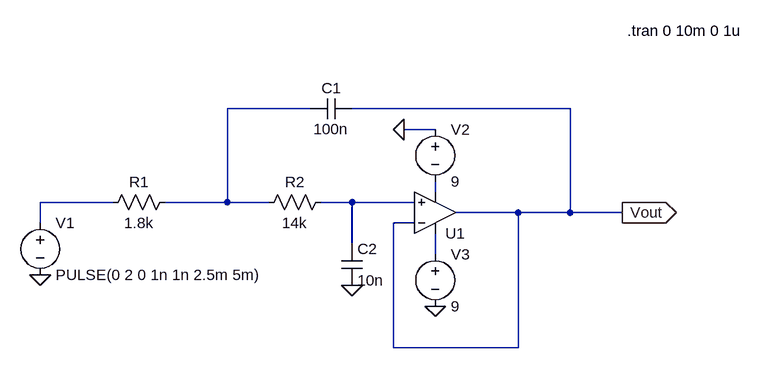
[diagram p0: schematic sallen_key_lowpass.asc]
sallen_key_lowpass.asc, the LTspice schematic file:
Version 4.1
SHEET 1 1196 680
WIRE 512 -16 384 -16
WIRE 912 -16 576 -16
WIRE 704 16 656 16
WIRE 704 112 704 96
WIRE 208 128 96 128
WIRE 384 128 384 -16
WIRE 384 128 288 128
WIRE 448 128 384 128
WIRE 576 128 528 128
WIRE 672 128 576 128
WIRE 832 144 736 144
WIRE 912 144 912 -16
WIRE 912 144 832 144
WIRE 992 144 912 144
WIRE 96 160 96 128
WIRE 672 160 640 160
WIRE 576 192 576 128
WIRE 704 208 704 176
WIRE 640 352 640 160
WIRE 832 352 832 144
WIRE 832 352 640 352
FLAG 576 256 0
FLAG 96 240 0
FLAG 656 16 0
FLAG 704 288 0
FLAG 992 144 Vout
IOPIN 992 144 Out
SYMBOL voltage 96 144 R0
WINDOW 123 0 0 Left 0
WINDOW 39 0 0 Left 0
SYMATTR InstName V1
SYMATTR Value PULSE(0 2 0 1n 1n 2.5m 5m)
SYMBOL res 304 112 R90
WINDOW 0 0 56 VBottom 2
WINDOW 3 32 56 VTop 2
SYMATTR InstName R1
SYMATTR Value 1.8k
SYMBOL res 544 112 R90
WINDOW 0 0 56 VBottom 2
WINDOW 3 32 56 VTop 2
SYMATTR InstName R2
SYMATTR Value 14k
SYMBOL cap 576 -32 R90
WINDOW 0 0 32 VBottom 2
WINDOW 3 32 32 VTop 2
SYMATTR InstName C1
SYMATTR Value 100n
SYMBOL cap 560 192 R0
SYMATTR InstName C2
SYMATTR Value 10n
SYMBOL OpAmps\\UniversalOpAmp2 704 144 M180
SYMATTR InstName U1
SYMBOL voltage 704 0 R0
WINDOW 123 0 0 Left 0
WINDOW 39 0 0 Left 0
SYMATTR InstName V2
SYMATTR Value 9
SYMBOL voltage 704 192 R0
WINDOW 123 0 0 Left 0
WINDOW 39 0 0 Left 0
SYMATTR InstName V3
SYMATTR Value 9
TEXT 1000 -136 Left 2 !.tran 0 10m 0 1u

The netlist it stands for:
* sallen_key_lowpass.asc
V1 N003 0 PULSE(0 2 0 1n 1n 2.5m 5m)
R1 N001 N003 1.8k
R2 N004 N001 14k
C1 Vout N001 100n
C2 N004 0 10n
X§U1 N004 Vout N005 N002 Vout level2 Avol=1Meg GBW=10Meg Slew=10Meg Ilimit=25m Rail=0 Vos=0 En=0 Enk=0 In=0 Ink=0 Rin=500Meg  ; pins In+ In- V+ V- OUT
V2 0 N002 9
V3 N005 0 9
.tran 0 10m 0 1u
.lib UniversalOpAmp2.lib
.backanno
.end